# EAGLE design select_bus_v1 (EAGLE 8.6.1)
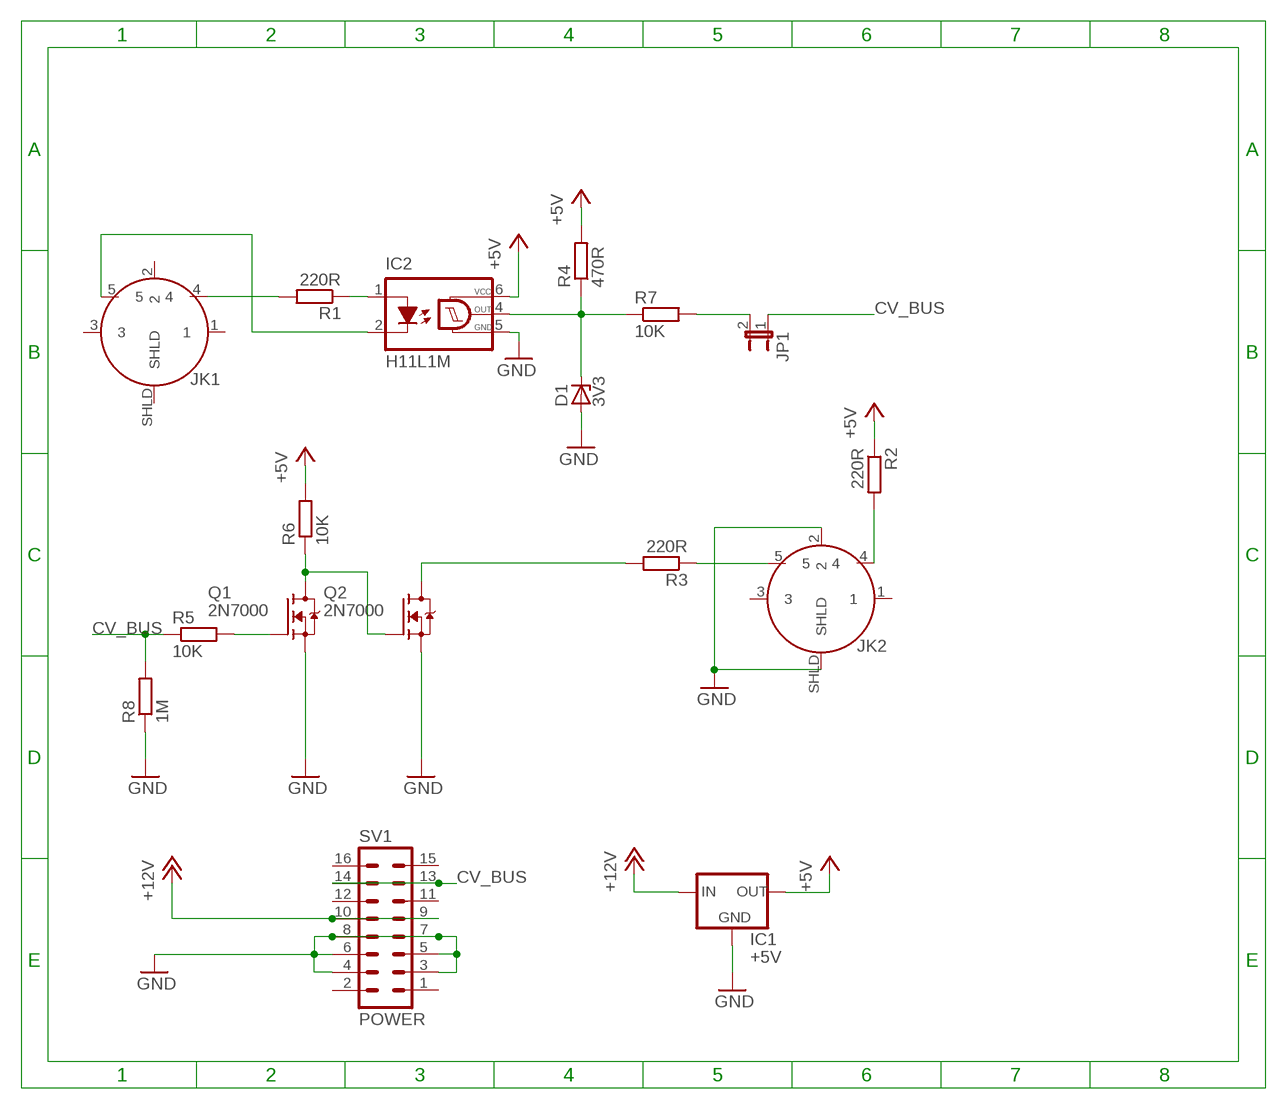
[diagram p0: schematic, sheet 1]

## Parts
D1  3V3  ZPY  [DO41Z10]
IC1  +5V  78LXX  [78LXX]
IC2  H11L1M  [DIL06]
JK1  13HP021PCB  [13HP021PCB]
JK2  13HP021PCB  [13HP021PCB]
JP1  JP1E  [JP1]
Q1  2N7000  [TO92]
Q2  2N7000  [TO92]
R1  220R  R-EU_0207/10  [0207/10]
R2  220R  R-EU_0207/10  [0207/10]
R3  220R  R-EU_0207/10  [0207/10]
R4  470R  R-EU_0207/10  [0207/10]
R5  10K  R-EU_0207/10  [0207/10]
R6  10K  R-EU_0207/10  [0207/10]
R7  10K  R-EU_0207/2V  [0207/2V]
R8  1M  R-EU_0207/10  [0207/10]
SV1  POWER  ML16  [ML16]

## Nets
+5V [power]: IC1.OUT IC2.6(VCC) R2.1 R4.2 R6.2
+12V [power]: IC1.IN SV1.9 SV1.10
CV_BUS: JP1.1 R5.1 R8.2 SV1.13 SV1.14
GND [power]: D1.A IC1.GND IC2.5(GND) JK2.2 JK2.SHLD Q1.1(S) Q2.1(S) R8.1 SV1.3 SV1.4 SV1.5 SV1.6 SV1.7 SV1.8
N$1: JP1.2 R7.2
N$2: JK2.5 R3.1
N$3: JK1.4 R1.2
N$4: Q2.3(D) R3.2
N$12: JK2.4 R2.2
N$33: IC2.1(A) R1.1
N$35: IC2.2(C) JK1.5
N$37: Q1.2(G) R5.2
U1RX: D1.C IC2.4(OUT) R4.1 R7.1
U1TX: Q1.3(D) Q2.2(G) R6.1
Unconnected: JK1.1 JK1.2 JK1.3 JK1.SHLD JK2.1 JK2.3 SV1.1 SV1.2 SV1.11 SV1.12 SV1.15 SV1.16

## Library data of the parts
D1 = diode:ZPY: Z DIODE 1 W
IC1 = v-reg:78LXX: VOLTAGE REGULATOR
IC2 = optocoupler:H11L*M: 6-Pin DIP Optocoupler Source: http://www.fairchildsemi.com/ds/H1/H11L2-M.pdf; MF: FAIRCHILD SEMICONDUCTOR; MPN: H11L1-M; OC_FARNELL: 1021127; OC_NEWARK: 72K8643
JK1 JK2 = digital-audio:13HP021PCB: 13HP021PCB 5 pin DIN 180 degree PCB mounting with panels holes
JP1 = jumper:JP1E: JUMPER
Q1 Q2 = digital-audio:2N7000: 2N7000 N-channel MOSFET
R1-R8 = rcl:R-EU_: RESISTOR, European symbol
SV1 = digital-audio:ML16: MULTICOMP - MC9A12-1634

## Net classes
1 pcm1680: width 0.35 mm
3 output: width 0.61 mm, clearance 0.254 mm

## Board
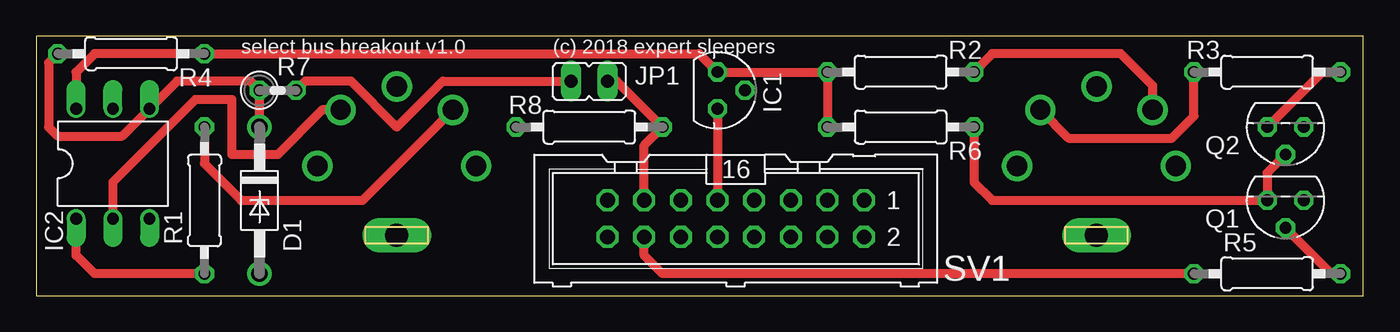
[diagram p1: board, top side]
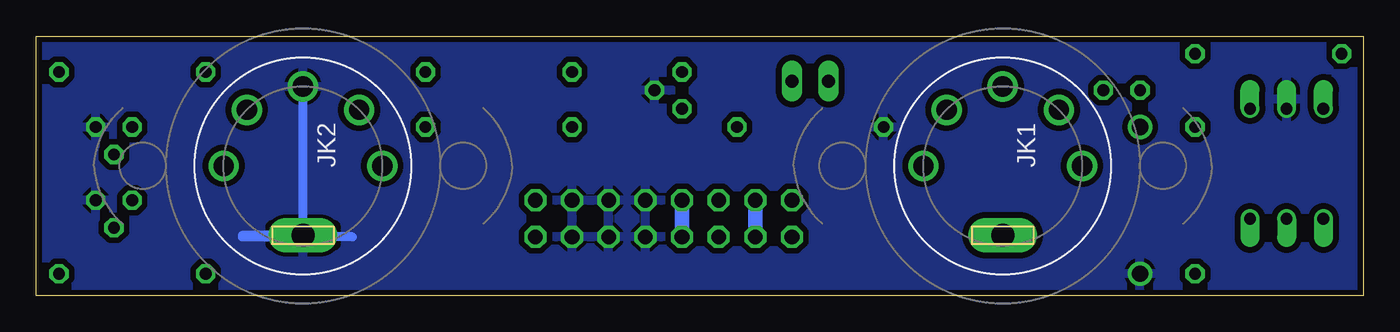
[diagram p2: board, bottom side, seen from below]

Size 92 x 18 mm. Coordinates in mm from the lower left corner, seen from the top.
Outline: 0,0 92,0 92,18 0,18 0,0
Copper layers (1*16): Top 0.035mm / dielectric 1.5mm / Bottom 0.035mm
Design rules "pcbtrain *": minimum track width 0.125mm, minimum drill 0.4mm, track to track 0.125mm, track to pad 0.125mm, pad to pad 0.125mm, via to via 0.125mm, smd to smd 0.125mm, copper to edge 0.25mm, drill to drill 8mil, minimum pad ring 10mil, minimum via ring 8mil, stop-mask expansion 4mil, vias tented up to drill 0mil, thermal gap 10mil

### Footprints (pad centres in the part's own frame; a part is rotated, then mirrored left to right if it is on the bottom)
DO41Z10 = drill 1.118: A 5.08,0; C -5.08,0
78LXX = drill 0.813 octagon: GND 0,1.905; IN 1.27,0; OUT -1.27,0
DIL06 = drill 0.813 offset: 1 -2.54,-3.81; 2 0,-3.81; 3 2.54,-3.81; 4 2.54,3.81; 5 0,3.81; 6 -2.54,3.81
13HP021PCB = drill 1.4: 1 0,-5.5; 2 -5.5,0; 3 0,5.5; 4 -3.889,-3.889; 5 -3.889,3.889 | drill 1.6 long: SHLD 4.8,0
JP1 = drill 0.914 long: 1 0,-1.27; 2 0,1.27
TO92 = drill 0.813 octagon: 1 -1.27,0; 2 0,1.905; 3 1.27,0
0207/10 = drill 0.813 octagon: 1 -5.08,0; 2 5.08,0
0207/2V = drill 0.813 octagon: 1 -1.27,0; 2 1.27,0
ML16 = drill 1.016 octagon: 1 -8.89,-1.27; 2 -8.89,1.27; 3 -6.35,-1.27; 4 -6.35,1.27; 5 -3.81,-1.27; 6 -3.81,1.27; 7 -1.27,-1.27; 8 -1.27,1.27; 9 1.27,-1.27; 10 1.27,1.27; 11 3.81,-1.27; 12 3.81,1.27; 13 6.35,-1.27; 14 6.35,1.27; 15 8.89,-1.27; 16 8.89,1.27

### Placement (x,y rotation side)
D1  15.48,6.62 270 top
IC1  47.23,14.24 270 top
IC2  5.32,9.16 0 top
JK1  25,9 270 bottom
JK2  73.5,9 270 bottom
JP1  38.34,14.88 90 top
Q1  86.6,6.62 180 top
Q2  86.6,11.7 180 top
R1  11.67,6.62 90 top
R2  59.93,15.51 0 top
R3  85.33,15.51 0 top
R4  6.59,16.78 0 top
R5  85.33,1.54 0 top
R6  59.93,11.7 180 top
R7  16.75,14.24 0 top
R8  38.34,11.7 0 top
SV1  48.5,5.35 180 top

### Tracks (layer width: path | path; a pad name or v marks a point on that pad's centre or on a via)
+5V
  Top 0.61: R6.2 R2.1 IC1.OUT 45.96,16.78 R4.2 4.05,16.78 2.78,15.51 IC2.6
+12V
  Top 0.61: IC1.IN SV1.9
  Bottom 1.016: SV1.10 SV1.9
CV_BUS
  Top 0.61: R5.1 43.42,1.54 42.15,2.81 SV1.14 | SV1.13 42.15,10.43 R8.2 40.24,14.88 JP1.1
  Bottom 1.016: SV1.14 SV1.13
GND
  Bottom 0.61: JK2.SHLD 77.71,4.2 77.71,4.08 73.5,4.08 | 70.09,4.08 73.5,4.08 | 73.5,4.08 JK2.2
  pour Bottom (isolate 0.406): 0,0 92,0 92,18 0,18
N$1
  Top 0.61: JP1.2 28.18,14.88 25.01,11.7 21.83,14.88 18.66,14.88 R7.2
N$2
  Top 0.61: JK2.5 71.56,10.94 78.73,10.94 80.25,12.46 R3.1
N$3
  Top 0.61: JK1.4 22.62,6.62 14.21,6.62 11.67,9.16 R1.2
N$4
  Top 0.61: Q2.3 89.14,15.51 R3.2
N$12
  Top 0.61: JK2.4 77.39,14.56 75.17,16.78 66.28,16.78 R2.2
N$33
  Top 0.61: R1.1 4.05,1.54 2.78,2.81 IC2.1
N$35
  Top 0.61: JK1.5 19.84,12.89 16.75,9.79 13.57,9.79 13.57,13.61 11.04,13.61 5.32,7.89 IC2.2
N$37
  Top 0.61: Q1.2 89.78,1.54 R5.2
U1RX
  Top 0.61: D1.C R7.1 14.84,14.88 9.77,14.88 IC2.4 5.95,11.06 1.51,11.06 0.88,11.7 0.88,16.14 R4.1
U1TX
  Top 0.61: Q2.2 85.33,8.53 Q1.3 66.28,6.62 65.01,7.89 R6.1

### Text on the board
tPlace: select bus breakout v1.0 | (c) 2018 expert sleepers